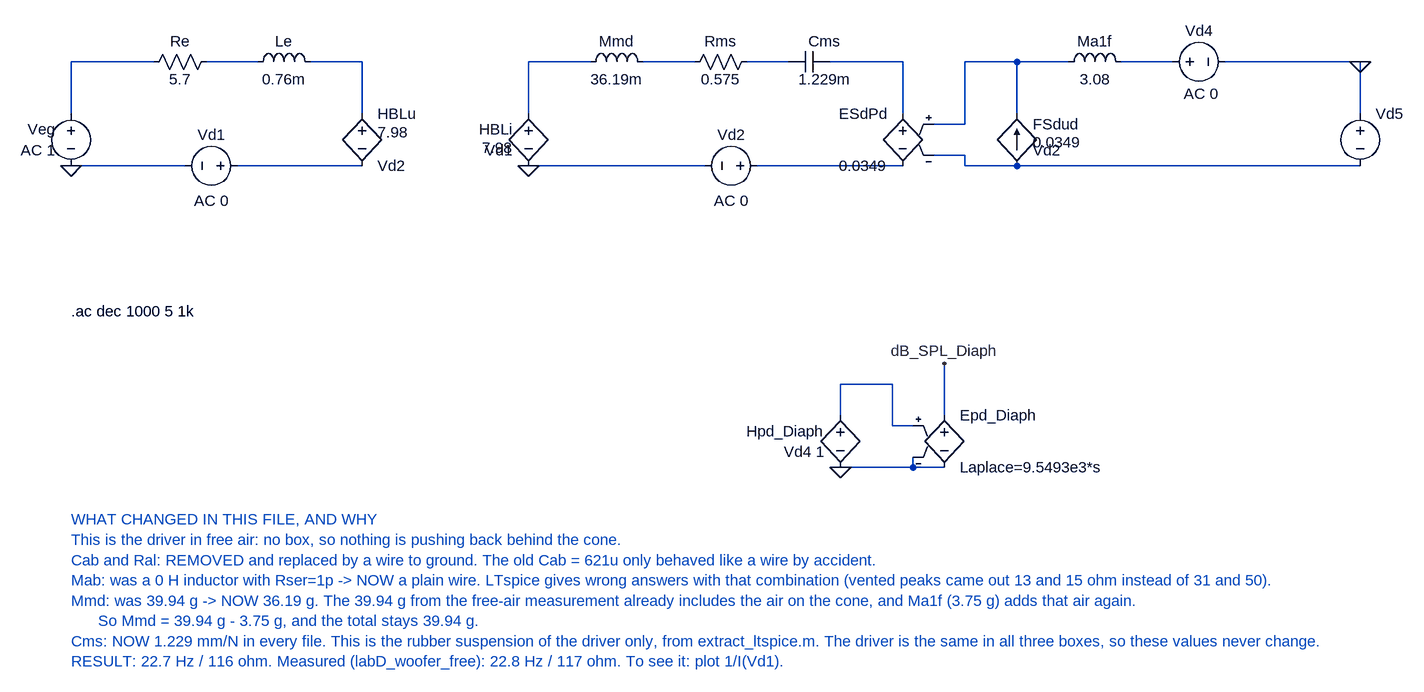
[diagram p0: schematic Open_Box_26W8534G00.asc]
Open_Box_26W8534G00.asc, the LTspice schematic file:
Version 4.1
SHEET 1 3920 1000
WIRE 128 -144 0 -144
WIRE 288 -144 208 -144
WIRE 448 -144 368 -144
WIRE 800 -144 704 -144
WIRE 960 -144 880 -144
WIRE 1104 -144 1040 -144
WIRE 1280 -144 1168 -144
WIRE 1456 -144 1376 -144
WIRE 1536 -144 1456 -144
WIRE 1696 -144 1616 -144
WIRE 1856 -144 1776 -144
WIRE 1984 -144 1856 -144
WIRE 0 -64 0 -144
WIRE 448 -64 448 -144
WIRE 704 -64 704 -144
WIRE 1280 -64 1280 -144
WIRE 1456 -64 1456 -144
WIRE 1984 -64 1984 -80
WIRE 1376 -48 1376 -144
WIRE 1376 -48 1328 -48
WIRE 1376 0 1328 0
WIRE 176 16 0 16
WIRE 448 16 256 16
WIRE 976 16 704 16
WIRE 1280 16 1056 16
WIRE 1376 16 1376 0
WIRE 1456 16 1376 16
WIRE 1616 16 1456 16
WIRE 1856 16 1696 16
WIRE 1984 16 1856 16
WIRE 1264 352 1184 352
WIRE 1184 400 1184 352
WIRE 1344 400 1344 320
WIRE 1264 416 1264 352
WIRE 1296 416 1264 416
WIRE 1296 480 1296 464
WIRE 1296 480 1184 480
WIRE 1344 480 1296 480
WIRE 1696 16 1616 16
WIRE 1984 -80 1984 -144
FLAG 0 16 0
FLAG 704 16 0
FLAG 1984 -144 0
FLAG 1184 480 0
FLAG 1344 320 dB_SPL_Diaph
SYMBOL voltage 0 -80 R0
WINDOW 0 -24 40 Right 2
WINDOW 3 -24 72 Right 2
WINDOW 123 -24 72 Right 2
SYMATTR InstName Veg
SYMATTR Value ""
SYMATTR Value2 AC 1
SYMBOL res 112 -128 R270
WINDOW 0 32 56 VTop 2
WINDOW 3 5 56 VBottom 2
SYMATTR InstName Re
SYMATTR Value 5.7
SYMBOL ind 272 -128 R270
WINDOW 0 32 56 VTop 2
WINDOW 3 5 56 VBottom 2
SYMATTR InstName Le
SYMATTR Value 0.76m
SYMATTR SpiceLine Rser=1p
SYMBOL h 448 -80 R0
WINDOW 123 24 44 Left 2
SYMATTR InstName HBLu
SYMATTR Value Vd2
SYMATTR Value2 7.98
SYMBOL voltage 272 16 R90
WINDOW 0 -32 56 VBottom 2
WINDOW 3 32 56 VTop 2
WINDOW 123 69 56 VBottom 2
WINDOW 39 0 0 Left 0
SYMATTR InstName Vd1
SYMATTR Value ""
SYMATTR Value2 AC 0
SYMBOL h 704 -80 R0
WINDOW 0 -24 40 Right 2
WINDOW 3 -24 72 Right 2
WINDOW 123 -24 68 Right 2
SYMATTR InstName HBLi
SYMATTR Value Vd1
SYMATTR Value2 7.98
SYMBOL ind 784 -128 R270
WINDOW 0 32 56 VTop 2
WINDOW 3 5 56 VBottom 2
SYMATTR InstName Mmd
SYMATTR Value 36.19m
SYMATTR SpiceLine Rser=1p
SYMBOL res 944 -128 R270
WINDOW 0 32 56 VTop 2
WINDOW 3 5 56 VBottom 2
SYMATTR InstName Rms
SYMATTR Value 0.575
SYMBOL cap 1104 -128 R270
WINDOW 0 32 56 VTop 2
WINDOW 3 5 56 VBottom 2
SYMATTR InstName Cms
SYMATTR Value 1.229m
SYMBOL e 1280 -80 M0
SYMATTR InstName ESdPd
SYMATTR Value 0.0349
SYMBOL voltage 1072 16 R90
WINDOW 0 -32 56 VBottom 2
WINDOW 3 32 56 VTop 2
WINDOW 123 69 56 VBottom 2
WINDOW 39 0 0 Left 0
SYMATTR InstName Vd2
SYMATTR Value ""
SYMATTR Value2 AC 0
SYMBOL f 1456 16 R180
WINDOW 0 -24 64 Right 2
WINDOW 3 -24 24 Right 2
WINDOW 123 -24 36 Right 2
SYMATTR InstName FSdud
SYMATTR Value Vd2
SYMATTR Value2 0.0349
SYMBOL ind 1520 -128 R270
WINDOW 0 32 56 VTop 2
WINDOW 3 5 56 VBottom 2
SYMATTR InstName Ma1f
SYMATTR Value 3.08
SYMATTR SpiceLine Rser=1p
SYMBOL voltage 1680 -144 R270
WINDOW 0 32 56 VTop 2
WINDOW 3 -32 56 VBottom 2
WINDOW 123 -65 59 VTop 2
WINDOW 39 0 0 Left 0
SYMATTR InstName Vd4
SYMATTR Value ""
SYMATTR Value2 AC 0
SYMBOL voltage 1984 -80 R0
WINDOW 39 0 0 Left 0
SYMATTR InstName Vd5
SYMATTR Value ""
SYMATTR Value2 AC 0
SYMBOL h 1184 384 R0
WINDOW 0 -24 40 Right 2
WINDOW 3 -24 72 Right 2
WINDOW 123 -24 72 Right 2
SYMATTR InstName Hpd_Diaph
SYMATTR Value Vd4 1
SYMBOL e 1344 384 R0
SYMATTR InstName Epd_Diaph
SYMATTR Value Laplace=9.5493e3*s
TEXT 0 240 Left 2 !.ac dec 1000 5 1k
TEXT 0 560 Left 2 ;WHAT CHANGED IN THIS FILE, AND WHY\nThis is the driver in free air: no box, so nothing is pushing back behind the cone.\nCab and Ral: REMOVED and replaced by a wire to ground. The old Cab = 621u only behaved like a wire by accident.\nMab: was a 0 H inductor with Rser=1p -> NOW a plain wire. LTspice gives wrong answers with that combination (vented peaks came out 13 and 15 ohm instead of 31 and 50).\nMmd: was 39.94 g -> NOW 36.19 g. The 39.94 g from the free-air measurement already includes the air on the cone, and Ma1f (3.75 g) adds that air again.\n      So Mmd = 39.94 g - 3.75 g, and the total stays 39.94 g.\nCms: NOW 1.229 mm/N in every file. This is the rubber suspension of the driver only, from extract_ltspice.m. The driver is the same in all three boxes, so these values never change.\nRESULT: 22.7 Hz / 116 ohm. Measured (labD_woofer_free): 22.8 Hz / 117 ohm. To see it: plot 1/I(Vd1).

The netlist it stands for:
* Open_Box_26W8534G00.asc
Veg N001 0 AC 1
Re N001 N002 5.7
Le N002 N003 0.76m Rser=1p
HBLu N003 N011 Vd2 7.98
Vd1 N011 0 AC 0
HBLi N004 0 Vd1 7.98
L§Mmd N004 N005 36.19m Rser=1p
Rms N005 N006 0.575
Cms N006 N007 1.229m
ESdPd N007 N012 N008 N010 0.0349
Vd2 N012 0 AC 0
FSdud N010 N008 Vd2 0.0349
L§Ma1f N008 N009 3.08 Rser=1p
Vd4 N009 0 AC 0
Vd5 0 N010 AC 0
Hpd_Diaph N013 0 Vd4 1
Epd_Diaph dB_SPL_Diaph 0 N013 0 Laplace=9.5493e3*s
.ac dec 1000 5 1k
* WHAT CHANGED IN THIS FILE, AND WHY
* This is the driver in free air: no box, so nothing is pushing back behind the cone.
* Cab and Ral: REMOVED and replaced by a wire to ground. The old Cab = 621u only behaved like a wire by accident.
* Mab: was a 0 H inductor with Rser=1p -> NOW a plain wire. LTspice gives wrong answers with that combination (vented peaks came out 13 and 15 ohm instead of 31 and 50).
* Mmd: was 39.94 g -> NOW 36.19 g. The 39.94 g from the free-air measurement already includes the air on the cone, and Ma1f (3.75 g) adds that air again.
*       So Mmd = 39.94 g - 3.75 g, and the total stays 39.94 g.
* Cms: NOW 1.229 mm/N in every file. This is the rubber suspension of the driver only, from extract_ltspice.m. The driver is the same in all three boxes, so these values never change.
* RESULT: 22.7 Hz / 116 ohm. Measured (labD_woofer_free): 22.8 Hz / 117 ohm. To see it: plot 1/I(Vd1).
.backanno
.end